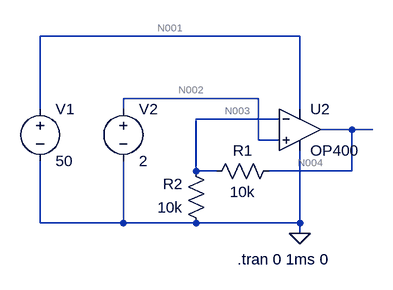
[diagram p0: schematic Op_amp_testing.asc]
Op_amp_testing.asc, the LTspice schematic file:
Version 4.1
SHEET 1 880 680
WIRE 304 16 -96 16
WIRE 240 112 32 112
WIRE -96 128 -96 16
WIRE 32 128 32 112
WIRE 304 128 304 16
WIRE 272 144 144 144
WIRE 384 160 336 160
WIRE 416 160 384 160
WIRE 240 176 240 112
WIRE 272 176 240 176
WIRE 144 224 144 144
WIRE 176 224 144 224
WIRE 384 224 384 160
WIRE 384 224 256 224
WIRE -96 304 -96 208
WIRE 32 304 32 208
WIRE 32 304 -96 304
WIRE 144 304 32 304
WIRE 304 304 304 192
WIRE 304 304 144 304
WIRE 304 320 304 304
FLAG 304 320 0
SYMBOL voltage -96 112 R0
WINDOW 123 0 0 Left 0
WINDOW 39 0 0 Left 0
SYMATTR InstName V1
SYMATTR Value 50
SYMBOL voltage 32 112 R0
WINDOW 123 0 0 Left 0
WINDOW 39 0 0 Left 0
SYMATTR InstName V2
SYMATTR Value 2
SYMBOL res 272 208 R90
WINDOW 0 0 56 VBottom 2
WINDOW 3 32 56 VTop 2
SYMATTR InstName R1
SYMATTR Value 10k
SYMBOL res 160 320 R180
WINDOW 0 36 76 Left 2
WINDOW 3 36 40 Left 2
SYMATTR InstName R2
SYMATTR Value 10k
SYMBOL OpAmps\\OP400 304 96 R0
SYMATTR InstName U2
TEXT 208 360 Left 2 !.tran 0 1ms 0

The netlist it stands for:
* Op_amp_testing.asc
V1 N001 0 50
V2 N002 0 2
R1 N004 N003 10k
R2 0 N003 10k
X§U2 N002 N003 N001 0 N004 OP400  ; pins In+ In- V+ V- OUT
.tran 0 1ms 0
.backanno
.end

* Results of the author's LTspice run, read from the files saved beside the schematic
* Operating Point, zero values left out:
*   V(n001) = 50 V
*   V(n002) = 2 V
*   V(n003) = 2.6 V
*   V(n004) = 5.2 V
*   I(R1) = 260 µA
*   I(R2) = -260 µA
*   I(V1) = -906.1 µA
*   I(V2) = 60.72 nA
*   Ix(u2:1) = -60.72 nA
*   Ix(u2:2) = 59.11 nA
*   Ix(u2:3) = 906.1 µA
*   Ix(u2:4) = -646.1 µA
*   Ix(u2:5) = -260 µA